# Altium project 9DB102BGILF.PrjPcb
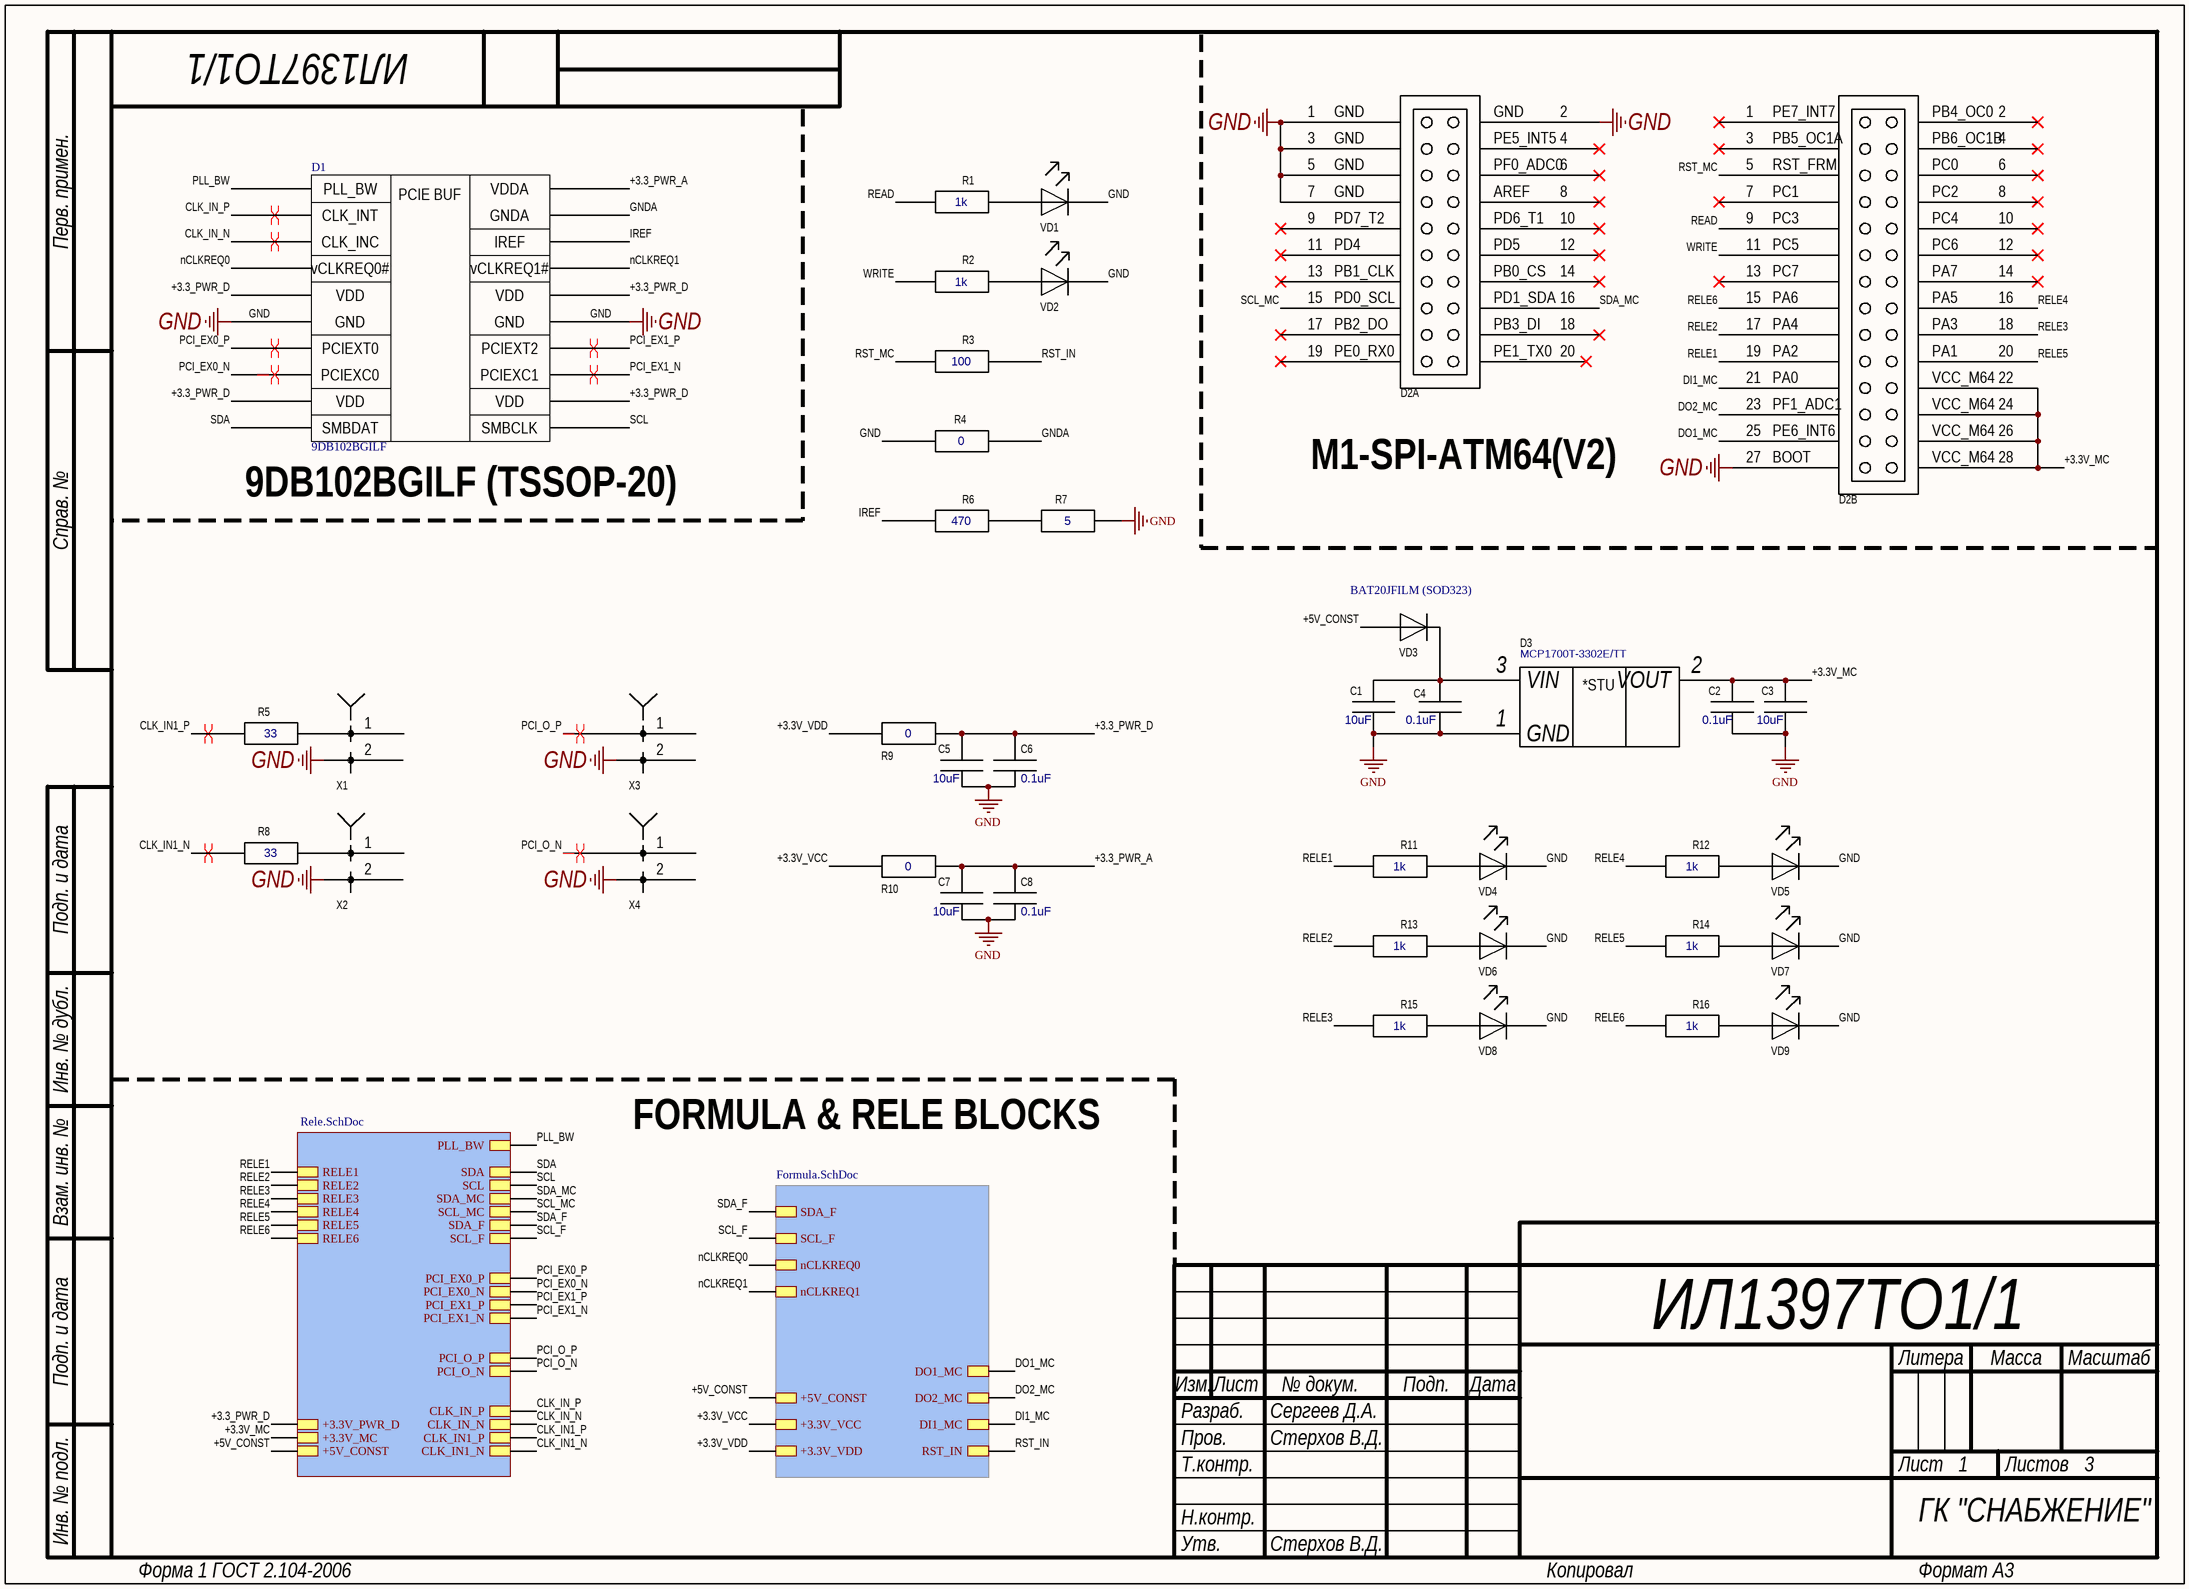
[diagram p0: Main scheme.SchDoc]
3 sheets, 91 parts. Net scope: hierarchical (ports join the sheet entries above them; power ports are global).
Board file: PCB1.PcbDoc
Sheets:
  Main scheme.SchDoc
    Formula connector = Formula.SchDoc
    RELE = Rele.SchDoc

## Sheet Main scheme.SchDoc
size 410 x 297 mm; ApprovedBy: Стерхов В.Д.; CheckedBy: Стерхов В.Д.; Author: Сергеев Д.А.; CompanyName: ГК "СНАБЖЕНИЕ"; DrawnBy: Сергеев Д.А.; Engineer: Сергеев Д.А.; Organization: ГК "СНАБЖЕНИЕ"; DocumentNumber: ИЛ1397ТО1/1; Revision: ИЛ1397ТО1/1; SheetNumber: 1; SheetTotal: 3

### Parts
C1  10uF  [0805]
C2  0.1uF  [0805]
C3  10uF  [0805]
C4  0.1uF  [0805]
C5  10uF  [0805]
C6  0.1uF  [0805]
C7  10uF  [0805]
C8  0.1uF  [0805]
D1  9DB102BGILF  [TSSOP-20 to DIP-20]
D2  M1-SPI-ATM64(V2)  [M1-SPI-ATM64(V2)]  (value not drawn)  (parts A,B of 2)
D3  MCP1700T-3302E/TT  [SOT-23]
R1  1k  [0805]
R2  1k  [0805]
R3  100  [0805]
R4  0  [0805]
R5  33  [0805]
R6  470  [0805]
R7  5  [0805]
R8  33  [0805]
R9  0  [0805]
R10  0  [0805]
R11  1k  [0805]
R12  1k  [0805]
R13  1k  [0805]
R14  1k  [0805]
R15  1k  [0805]
R16  1k  [0805]
VD1  LED(0805)  [0805(LED)]  (value not drawn)
VD2  LED(0805)  [0805(LED)]  (value not drawn)
VD3  BAT20JFILM (SOD323)  [SOD323]
VD4  LED(0805)  [0805(LED)]  (value not drawn)
VD5  LED(0805)  [0805(LED)]  (value not drawn)
VD6  LED(0805)  [0805(LED)]  (value not drawn)
VD7  LED(0805)  [0805(LED)]  (value not drawn)
VD8  LED(0805)  [0805(LED)]  (value not drawn)
VD9  LED(0805)  [0805(LED)]  (value not drawn)
X1  KLS1-SMA002-B  [KLS1-SMA002-B]  (value not drawn)
X2  KLS1-SMA002-B  [KLS1-SMA002-B]  (value not drawn)
X3  KLS1-SMA002-B  [KLS1-SMA002-B]  (value not drawn)
X4  KLS1-SMA002-B  [KLS1-SMA002-B]  (value not drawn)

### Sub-sheets
Formula connector = Formula.SchDoc: +5V_CONST, +3.3V_VCC, +3.3V_VDD, SDA_F, SCL_F, DI1_MC, RST_IN, nCLKREQ0, nCLKREQ1, DO1_MC, DO2_MC
RELE = Rele.SchDoc: SCL_MC, RELE3, PCI_EX1_N, +5V_CONST, PCI_O_N, SCL_F, SDA, RELE1, CLK_IN1_P, CLK_IN1_N, SDA_MC, PCI_O_P, RELE5, SCL, +3.3V_MC, RELE6, RELE2, SDA_F, PCI_EX0_N, CLK_IN_P, +3.3V_PWR_D, PCI_EX0_P, CLK_IN_N, PCI_EX1_P, RELE4, PLL_BW

### Nets
GND: C1.2 C2.2 C3.2 C4.2 C5.2 C6.2 C7.2 C8.2 D1.6 D1.15 D2.1X2 D2.2X2 D2.3X2 D2.5X2 D2.7X2 D2.27X3 D3.1(GND) R4.1 R7.2 VD1.2(K) VD2.2(K) VD4.2(K) VD5.2(K) VD6.2(K) VD7.2(K) VD8.2(K) VD9.2(K) X1.2 X2.2 X3.2 X4.2
+3.3_PWR_A: C7.1 C8.1 D1.20 R10.2
+3.3_PWR_D: C5.1 C6.1 D1.5 D1.9 D1.12 D1.16 R9.2 ; sheet RELE/+3.3V_PWR_D
+3.3V_MC: C2.1 C3.1 D2.22X3 D2.24X3 D2.26X3 D2.28X3 D3.2(VOUT) ; sheet RELE/+3.3V_MC
+3.3V_VCC: R10.1 ; sheet Formula connector/+3.3V_VCC
+3.3V_VDD: R9.1 ; sheet Formula connector/+3.3V_VDD
+5V_CONST: VD3.1(A) ; sheet Formula connector/+5V_CONST, sheet RELE/+5V_CONST
CLK_IN1_N: R8.1 ; sheet RELE/CLK_IN1_N
CLK_IN1_P: R5.1 ; sheet RELE/CLK_IN1_P
CLK_IN_N: D1.3 ; sheet RELE/CLK_IN_N
CLK_IN_P: D1.2 ; sheet RELE/CLK_IN_P
DI1_MC: D2.21X3 ; sheet Formula connector/DI1_MC
DO1_MC: D2.25X3 ; sheet Formula connector/DO1_MC
DO2_MC: D2.23X3 ; sheet Formula connector/DO2_MC
GNDA: D1.19 R4.2
IREF: D1.18 R6.1
nCLKREQ0: D1.4 ; sheet Formula connector/nCLKREQ0
nCLKREQ1: D1.17 ; sheet Formula connector/nCLKREQ1
PCI_EX0_N: D1.8 ; sheet RELE/PCI_EX0_N
PCI_EX0_P: D1.7 ; sheet RELE/PCI_EX0_P
PCI_EX1_N: D1.13 ; sheet RELE/PCI_EX1_N
PCI_EX1_P: D1.14 ; sheet RELE/PCI_EX1_P
PCI_O_N: X4.1 ; sheet RELE/PCI_O_N
PCI_O_P: X3.1 ; sheet RELE/PCI_O_P
PLL_BW: D1.1 ; sheet RELE/PLL_BW
READ: D2.9X3 R1.1
RELE1: D2.19X3 R11.1 ; sheet RELE/RELE1
RELE2: D2.17X3 R13.1 ; sheet RELE/RELE2
RELE3: D2.18X3 R15.1 ; sheet RELE/RELE3
RELE4: D2.16X3 R12.1 ; sheet RELE/RELE4
RELE5: D2.20X3 R14.1 ; sheet RELE/RELE5
RELE6: D2.15X3 R16.1 ; sheet RELE/RELE6
RST_IN: R3.2 ; sheet Formula connector/RST_IN
RST_MC: D2.5X3 R3.1
SCL: D1.11 ; sheet RELE/SCL
SCL_F: sheet Formula connector/SCL_F, sheet RELE/SCL_F
SCL_MC: D2.15X2 ; sheet RELE/SCL_MC
SDA: D1.10 ; sheet RELE/SDA
SDA_F: sheet Formula connector/SDA_F, sheet RELE/SDA_F
SDA_MC: D2.16X2 ; sheet RELE/SDA_MC
WRITE: D2.11X3 R2.1
NetC1_1: C1.1 C4.1 D3.3(VIN) VD3.2(K)
NetR1_2: R1.2 VD1.1(A)
NetR2_2: R2.2 VD2.1(A)
NetR5_2: R5.2 X1.1
NetR6_2: R6.2 R7.1
NetR8_2: R8.2 X2.1
NetR11_2: R11.2 VD4.1(A)
NetR12_2: R12.2 VD5.1(A)
NetR13_2: R13.2 VD6.1(A)
NetR14_2: R14.2 VD7.1(A)
NetR15_2: R15.2 VD8.1(A)
NetR16_2: R16.2 VD9.1(A)

Not connected (* = marked no-connect by the designer): D2 1X3* 2X3* 3X3* 4X2* 4X3* 6X2* 6X3* 7X3* 8X2* 8X3* 9X2* 10X2* 10X3* 11X2* 12X2* 12X3* 13X2* 13X3* 14X2* 14X3* 17X2* 18X2* 19X2* 20X2*

### Layout directives
differential pair: CLK_IN1_N, CLK_IN1_P, CLK_IN_N, CLK_IN_P, PCI_EX0_N, PCI_EX0_P, PCI_EX1_N, PCI_EX1_P, PCI_O_N, PCI_O_P

### Notes on the sheet
- M1-SPI-ATM64(V2)
- (near D1) 9DB102BGILF (TSSOP-20)
- FORMULA & RELE BLOCKS
- Перв. примен.
- Справ. №
- Подп. и дата
- Инв. № дубл.
- Взам. инв. №
- Разраб.
- Изм.
- Лист
- № докум.
- Подп.
- Дата
- Литера
- Масса
- Масштаб
- Пров.
- Т.контр.
- Листов
- Инв. № подл.
- Н.контр.
- Утв.
- Форма 1 ГОСТ 2.104-2006
- Копировал
- Формат А3
- (in symbol M1-SPI-ATM64(V2), part A) GND; 3; PE5_INT5; 4; 5; PF0_ADC0; 6; 7; AREF; 8; 9; PD7_T2; PD6_T1; 10; 11; PD4; PD5; 12; 13; PB1_CLK; PB0_CS; 14; 15; PD0_SCL; PD1_SDA; 16; 17; PB2_DO; PB3_DI; 18; 19; PE0_RX0; PE1_TX0; 20
- (in symbol M1-SPI-ATM64(V2), part B) PE7_INT7; PB4_OC0; 3; PB5_OC1A; PB6_OC1B; 4; 5; RST_FRM; PC0; 6; 7; PC1; PC2; 8; 9; PC3; PC4; 10; 11; PC5; PC6; 12; 13; PC7; PA7; 14; 15; PA6; PA5; 16; 17; PA4; PA3; 18; 19; PA2; PA1; 20; 21; PA0; VCC_M64; 22; 23; PF1_ADC1; 24; 25; PE6_INT6; 26; 27; BOOT; 28

### Library data of the parts
C1-C8 = C0805: ComponentHeigt: 1.3; Firme: AVX; Leadform: SMD; KIND: Конденсатор; ClassName: *; Component Link: *; ComponentWeigt: *; Packaging: 0805; NN: *; Value: *
D2 = M1-SPI-ATM64(V2): ComponentHeigt: 5.5; Name: Вилка; Specification: Вилка PLD2-2 *; Typ: PLD2-2; ClassName: *; Component Link: *; ComponentWeigt: *; Firme: *; Leadform: *; NN: *; KIND: *
D3 = MCP1700T-3302E/TT: ComponentHeigt: 1.8; Firme: Linear; Leadform: формована; Kind: Микросхема; ClassName: *; Component Link: *; Packaging: SOT-223; NN: *
R1-R5 R8-R16 = R0805 Yageo: ComponentHeigt: 0.6; Firme: Yageo; Leadform: SMD; Kind: Резистор; ClassName: *; ComponentWeigt: *; Component Link: *; Packaging: 0805; NN: *; Value: *
R6 R7 = R0805 Yageo: 1%; ComponentHeigt: 0.6; Firme: Yageo; Leadform: SMD; Kind: Резистор; ClassName: *; ComponentWeigt: *; Component Link: *; Packaging: 0805; NN: *; Value: *
VD1 VD2 VD4-VD9 = LED(0805): ComponentHeigt: 0.75; Leadform: в отверстия; Firme: Kingbright; NN: 24003000; KIND: Светодиод L-1154GD Kingbright; Component Link: *; ClassName: *
VD3 = BAT20JFILM (SOD323): ComponentHeigt: 0.75; Leadform: в отверстия; Firme: Kingbright; NN: 24003000; KIND: Светодиод L-1154GD Kingbright; Component Link: *; ClassName: *
X1-X4 = KLS1-SMA002-B: ComponentHeigt: 5.5; Name: Вилка; Specification: Вилка PLD2-2 *; Typ: PLD2-2; ClassName: *; Component Link: *; ComponentWeigt: *; Firme: *; Leadform: *; NN: *; KIND: *

## Sheet Formula.SchDoc: ИЛ1397ТО1/1
size 410 x 297 mm; ApprovedBy: Стерхов В.Д; CheckedBy: Стерхов В.Д; Author: Сергеев Д.А.; CompanyName: ГК "СНАБЖЕНИЕ"; DrawnBy: Сергеев Д.А.; Engineer: Сергеев Д.А.; Organization: ГК "СНАБЖЕНИЕ"; DocumentNumber: ИЛ1397ТО1/1; SheetNumber: 3; SheetTotal: 3
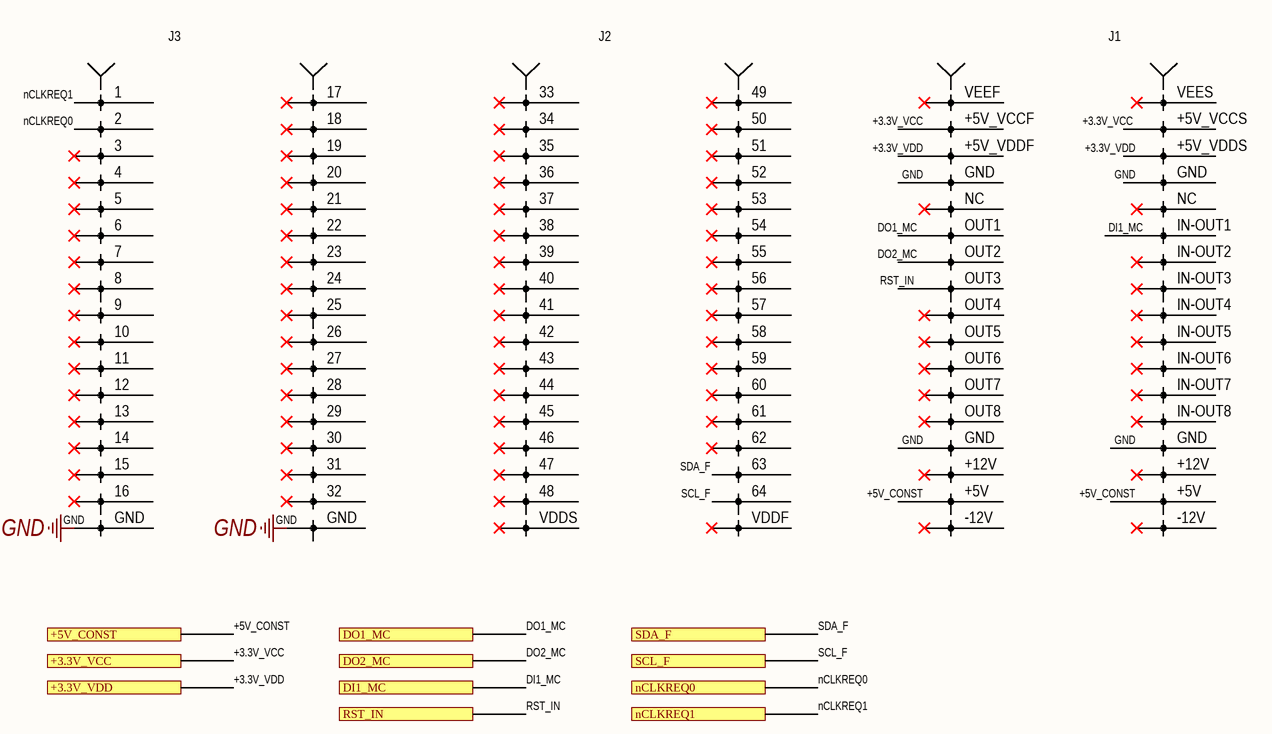
[diagram p1: Formula.SchDoc]

### Parts
X5  FORMULA  [FORMULA]  (value not drawn)

### Ports
+3.3V_VCC, +3.3V_VDD, +5V_CONST, DI1_MC, DO1_MC, DO2_MC, nCLKREQ0, nCLKREQ1, RST_IN, SCL_F, SDA_F

### Nets
GND: X5.GND
+3.3V_VCC: X5.+5V_VCCF(VCCF) X5.+5V_VCCS(VCCS) ; port +3.3V_VCC
+3.3V_VDD: X5.+5V_VDDF(VDDF) X5.+5V_VDDS(VDDS) ; port +3.3V_VDD
+5V_CONST: X5.+5V ; port +5V_CONST
DI1_MC: X5.IN-OUT1 ; port DI1_MC
DO1_MC: X5.OUT1 ; port DO1_MC
DO2_MC: X5.OUT2 ; port DO2_MC
nCLKREQ0: X5.2 ; port nCLKREQ0
nCLKREQ1: X5.1 ; port nCLKREQ1
RST_IN: X5.OUT3 ; port RST_IN
SCL_F: X5.64 ; port SCL_F
SDA_F: X5.63 ; port SDA_F

Not connected (* = marked no-connect by the designer): X5 3* 4* 5* 6* 7* 8* 9* 10* 11* 12* 13* 14* 15* 16* 17* 18* 19* 20* 21* 22* 23* 24* 25* 26* 27* 28* 29* 30* 31* 32* 33* 34* 35* 36(4)* 37(5)* 38* 39* 40* 41* 42* 43* 44* 45* 46* 47* 48* 49* 50* 51* 52* 53* 54* 55* 56* 57* 58* 59* 60* 61* 62* +12V* -12V* IN-OUT2* IN-OUT3* IN-OUT4* IN-OUT5* IN-OUT6* IN-OUT7* IN-OUT8* NC* OUT4* OUT5* OUT6* OUT7* OUT8* VDDF* VDDS* VEEF* VEES*

### Notes on the sheet
- Перв. примен.
- Справ. №
- Подп. и дата
- Инв. № дубл.
- Взам. инв. №
- Разраб.
- Изм.
- Лист
- № докум.
- Подп.
- Дата
- Литера
- Масса
- Масштаб
- Пров.
- Т.контр.
- Листов
- Инв. № подл.
- Н.контр.
- Утв.
- Форма 1 ГОСТ 2.104-2006
- Копировал
- Формат А3
- (in symbol FORMULA) J3; J2; J1

## Sheet Rele.SchDoc: ИЛ1397ТО1/1
size 410 x 297 mm; ApprovedBy: Стерхов В.Д.; CheckedBy: Стерхов В.Д.; Author: Сергеев Д.А.; CompanyName: ГК "СНАБЖЕНИЕ"; DrawnBy: Сергеев Д.А.; Engineer: Сергеев Д.А.; Organization: ГК "СНАБЖЕНИЕ"; DocumentNumber: ИЛ1397ТО1/1; SheetNumber: 2; SheetTotal: 3
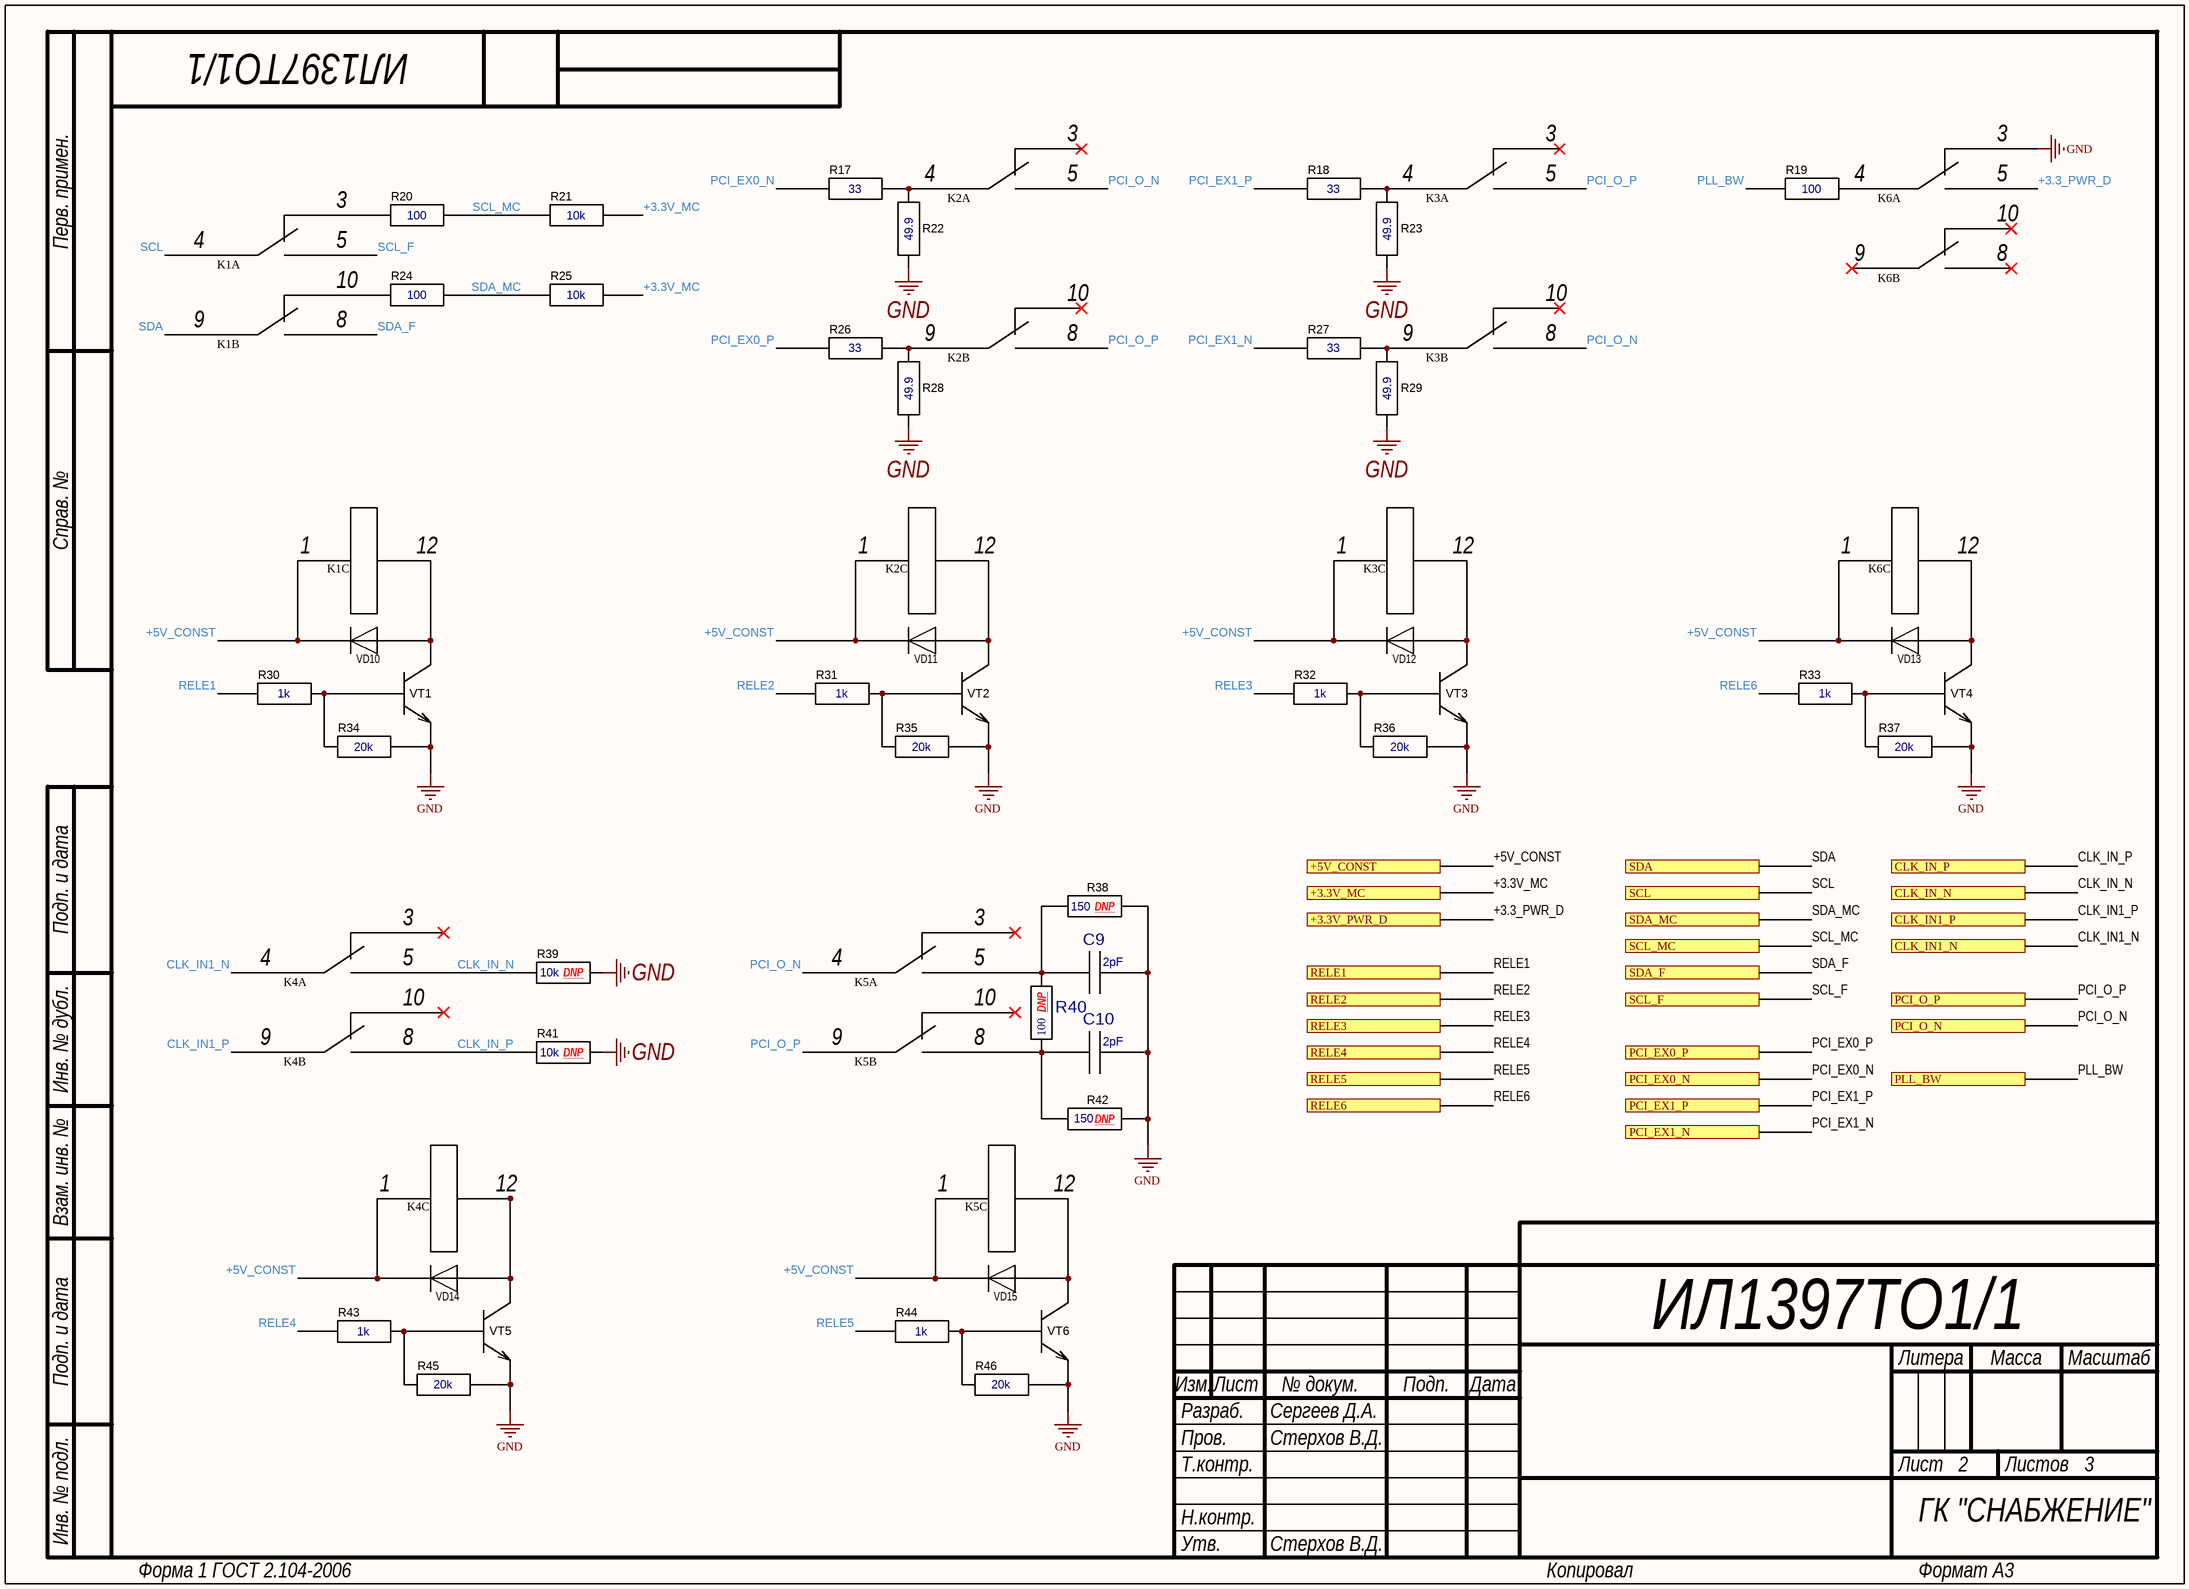
[diagram p2: Rele.SchDoc]

### Parts
C9  2pF  [0805]
C10  2pF  [0805]
K1  V23079A1001B301 TE  [V23079A1001B301]  (value not drawn)  (parts A,B,C of 3)
K2  V23079A1001B301 TE  [V23079A1001B301]  (value not drawn)  (parts A,B,C of 3)
K3  V23079A1001B301 TE  [V23079A1001B301]  (value not drawn)  (parts A,B,C of 3)
K4  V23079A1001B301 TE  [V23079A1001B301]  (value not drawn)  (parts A,B,C of 3)
K5  V23079A1001B301 TE  [V23079A1001B301]  (value not drawn)  (parts A,B,C of 3)
K6  V23079A1001B301 TE  [V23079A1001B301]  (value not drawn)  (parts A,B,C of 3)
R17  33  [0805]
R18  33  [0805]
R19  100  [0805]
R20  100  [0805]
R21  10k  [0805]
R22  49.9  [0805]
R23  49.9  [0805]
R24  100  [0805]
R25  10k  [0805]
R26  33  [0805]
R27  33  [0805]
R28  49.9  [0805]
R29  49.9  [0805]
R30  1k  [0805]
R31  1k  [0805]
R32  1k  [0805]
R33  1k  [0805]
R34  20k  [0805]
R35  20k  [0805]
R36  20k  [0805]
R37  20k  [0805]
R38  150  [0805]
R39  10k  [0805]
R40  100  [0603]
R41  10k  [0805]
R42  150  [0805]
R43  1k  [0805]
R44  1k  [0805]
R45  20k  [0805]
R46  20k  [0805]
VD10  LL4148 NXP  [SOD80C]  (value not drawn)
VD11  LL4148 NXP  [SOD80C]  (value not drawn)
VD12  LL4148 NXP  [SOD80C]  (value not drawn)
VD13  LL4148 NXP  [SOD80C]  (value not drawn)
VD14  LL4148 NXP  [SOD80C]  (value not drawn)
VD15  LL4148 NXP  [SOD80C]  (value not drawn)
VT1  MMBT5551L  [SOT-23]  (value not drawn)
VT2  MMBT5551L  [SOT-23]  (value not drawn)
VT3  MMBT5551L  [SOT-23]  (value not drawn)
VT4  MMBT5551L  [SOT-23]  (value not drawn)
VT5  MMBT5551L  [SOT-23]  (value not drawn)
VT6  MMBT5551L  [SOT-23]  (value not drawn)

### Ports
+3.3V_MC, +3.3V_PWR_D, +5V_CONST, CLK_IN1_N, CLK_IN1_P, CLK_IN_N, CLK_IN_P, PCI_EX0_N, PCI_EX0_P, PCI_EX1_N, PCI_EX1_P, PCI_O_N, PCI_O_P, PLL_BW, RELE1, RELE2, RELE3, RELE4, RELE5, RELE6, SCL, SCL_F, SCL_MC, SDA, SDA_F, SDA_MC

### Nets
GND: C9.2 C10.2 K6.3 R22.1 R23.1 R28.1 R29.1 R34.2 R35.2 R36.2 R37.2 R38.2 R39.2 R41.2 R42.1 R45.2 R46.2 VT1.2(E) VT2.2(E) VT3.2(E) VT4.2(E) VT5.2(E) VT6.2(E)
+3.3_PWR_D: K6.5 ; port +3.3V_PWR_D
+3.3V_MC: R21.2 R25.2 ; port +3.3V_MC
+5V_CONST: K1.1 K2.1 K3.1 K4.1 K5.1 K6.1 VD10.2(K) VD11.2(K) VD12.2(K) VD13.2(K) VD14.2(K) VD15.2(K) ; port +5V_CONST
CLK_IN1_N: K4.4 ; port CLK_IN1_N
CLK_IN1_P: K4.9 ; port CLK_IN1_P
CLK_IN_N: K4.5 R39.1 ; port CLK_IN_N
CLK_IN_P: K4.8 R41.1 ; port CLK_IN_P
PCI_EX0_N: R17.1 ; port PCI_EX0_N
PCI_EX0_P: R26.1 ; port PCI_EX0_P
PCI_EX1_N: R27.1 ; port PCI_EX1_N
PCI_EX1_P: R18.1 ; port PCI_EX1_P
PCI_O_N: K2.5 K3.8 K5.4 ; port PCI_O_N
PCI_O_P: K2.8 K3.5 K5.9 ; port PCI_O_P
PLL_BW: R19.1 ; port PLL_BW
RELE1: R30.1 ; port RELE1
RELE2: R31.1 ; port RELE2
RELE3: R32.1 ; port RELE3
RELE4: R43.1 ; port RELE4
RELE5: R44.1 ; port RELE5
RELE6: R33.1 ; port RELE6
SCL: K1.4 ; port SCL
SCL_F: K1.5 ; port SCL_F
SCL_MC: R20.2 R21.1 ; port SCL_MC
SDA: K1.9 ; port SDA
SDA_F: K1.8 ; port SDA_F
SDA_MC: R24.2 R25.1 ; port SDA_MC
NetC9_1: C9.1 K5.5 R38.1 R40.2
NetC10_1: C10.1 K5.8 R40.1 R42.2
NetK1_3: K1.3 R20.1
NetK1_10: K1.10 R24.1
NetK1_12: K1.12 VD10.1(A) VT1.3(K)
NetK2_4: K2.4 R17.2 R22.2
NetK2_9: K2.9 R26.2 R28.2
NetK2_12: K2.12 VD11.1(A) VT2.3(K)
NetK3_4: K3.4 R18.2 R23.2
NetK3_9: K3.9 R27.2 R29.2
NetK3_12: K3.12 VD12.1(A) VT3.3(K)
NetK4_12: K4.12 VD14.1(A) VT5.3(K)
NetK5_12: K5.12 VD15.1(A) VT6.3(K)
NetK6_4: K6.4 R19.2
NetK6_12: K6.12 VD13.1(A) VT4.3(K)
NetR30_2: R30.2 R34.1 VT1.1(B)
NetR31_2: R31.2 R35.1 VT2.1(B)
NetR32_2: R32.2 R36.1 VT3.1(B)
NetR33_2: R33.2 R37.1 VT4.1(B)
NetR43_2: R43.2 R45.1 VT5.1(B)
NetR44_2: R44.2 R46.1 VT6.1(B)

Not connected (* = marked no-connect by the designer): K2 3* 10*; K3 3* 10*; K4 3* 10*; K5 3* 10*; K6 8* 9* 10*

### Notes on the sheet
- (near R38) DNP
- (near R39) DNP
- (near R40) DNP
- (near R41) DNP
- (near R42) DNP
- Перв. примен.
- Справ. №
- Подп. и дата
- Инв. № дубл.
- Взам. инв. №
- Разраб.
- Изм.
- Лист
- № докум.
- Подп.
- Дата
- Литера
- Масса
- Масштаб
- Пров.
- Т.контр.
- Листов
- Инв. № подл.
- Н.контр.
- Утв.
- Форма 1 ГОСТ 2.104-2006
- Копировал
- Формат А3

### Library data of the parts
C9 C10 = C0805: as C1 on sheet Main scheme; ClassName: *; Component Link: *; ComponentWeigt: *; Packaging: 0805; NN: *; Value: *
R17-R39 R41-R46 = R0805 Yageo: as R1 on sheet Main scheme; ClassName: *; ComponentWeigt: *; Component Link: *; Packaging: 0805; NN: *; Value: *
R40 = R0603 Yageo: ComponentHeigt: 0.5; Firme: Yageo; Leadform: SMD; Kind: Резистор; ClassName: *; Component Link: *; Packaging: 0402; NN: *
VD10-VD15 = LL4148 NXP: ComponentHeigt: 1.6; Leadform: SMD; NN: 24009301; KIND: Диод LL4148 NXP; Component Link: http://www.nxp.com; Packaging: SOD-80C; ClassName: *; Firme: NXP
VT1-VT6 = MMBT5551L: ComponentHeigt: 1.1; Firme: ONS; Leadform: SMD; NN: 24007468; KIND: Транзистор MMBT5551L*G ONS; ClassName: *; ComponentWeigt: *; Packaging: SOT-23

## Nets that join several sheets
GND: Main scheme (31 pins), Formula (X5.GND), Rele (23 pins)
+3.3_PWR_D: Main scheme (7 pins), Rele (K6.5)
+3.3V_MC: Main scheme (7 pins), Rele (R21.2 R25.2)
+3.3V_VCC: Main scheme (R10.1), Formula (X5.+5V_VCCF X5.+5V_VCCS)
+3.3V_VDD: Main scheme (R9.1), Formula (X5.+5V_VDDF X5.+5V_VDDS)
+5V_CONST: Main scheme (VD3.1), Formula (X5.+5V), Rele (12 pins)
CLK_IN1_N: Main scheme (R8.1), Rele (K4.4)
CLK_IN1_P: Main scheme (R5.1), Rele (K4.9)
CLK_IN_N: Main scheme (D1.3), Rele (K4.5 R39.1)
CLK_IN_P: Main scheme (D1.2), Rele (K4.8 R41.1)
DI1_MC: Main scheme (D2.21X3), Formula (X5.IN-OUT1)
DO1_MC: Main scheme (D2.25X3), Formula (X5.OUT1)
DO2_MC: Main scheme (D2.23X3), Formula (X5.OUT2)
nCLKREQ0: Main scheme (D1.4), Formula (X5.2)
nCLKREQ1: Main scheme (D1.17), Formula (X5.1)
PCI_EX0_N: Main scheme (D1.8), Rele (R17.1)
PCI_EX0_P: Main scheme (D1.7), Rele (R26.1)
PCI_EX1_N: Main scheme (D1.13), Rele (R27.1)
PCI_EX1_P: Main scheme (D1.14), Rele (R18.1)
PCI_O_N: Main scheme (X4.1), Rele (K2.5 K3.8 K5.4)
PCI_O_P: Main scheme (X3.1), Rele (K2.8 K3.5 K5.9)
PLL_BW: Main scheme (D1.1), Rele (R19.1)
RELE1: Main scheme (D2.19X3 R11.1), Rele (R30.1)
RELE2: Main scheme (D2.17X3 R13.1), Rele (R31.1)
RELE3: Main scheme (D2.18X3 R15.1), Rele (R32.1)
RELE4: Main scheme (D2.16X3 R12.1), Rele (R43.1)
RELE5: Main scheme (D2.20X3 R14.1), Rele (R44.1)
RELE6: Main scheme (D2.15X3 R16.1), Rele (R33.1)
RST_IN: Main scheme (R3.2), Formula (X5.OUT3)
SCL: Main scheme (D1.11), Rele (K1.4)
SCL_F: Formula (X5.64), Rele (K1.5)
SCL_MC: Main scheme (D2.15X2), Rele (R20.2 R21.1)
SDA: Main scheme (D1.10), Rele (K1.9)
SDA_F: Formula (X5.63), Rele (K1.8)
SDA_MC: Main scheme (D2.16X2), Rele (R24.2 R25.1)